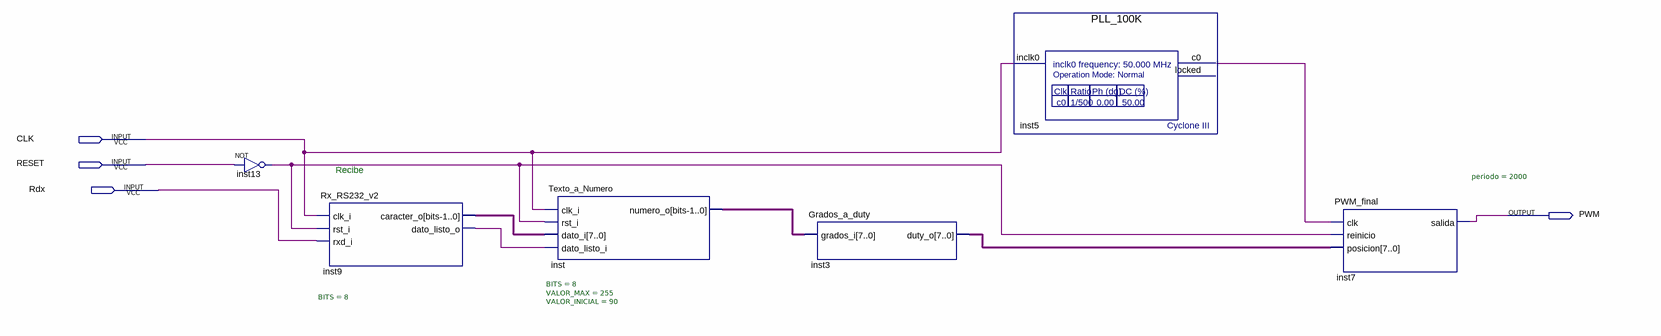
[diagram p0: schematic sheet]
// Quartus schematic Prueba_comunicacion.bdf as structural Verilog: 6 symbols, 4 pins
module Prueba_comunicacion (
  input  CLK,
  input  RESET,
  input  Rdx,
  output PWM
);

  wire inst5_c0, inst9_dato_listo_o, inst13_out;
  wire [7:0] inst3_duty_o, inst9_caracter_o, inst_numero_o;

  not inst13 (inst13_out, RESET);
  Rx_RS232_v2 #(.BITS(8)) inst9 (
    .clk_i(CLK), .rst_i(inst13_out), .rxd_i(Rdx), .caracter_o(inst9_caracter_o),
    .dato_listo_o(inst9_dato_listo_o));
  Texto_a_Numero #(.BITS(8), .VALOR_MAX(255), .VALOR_INICIAL(90)) inst (
    .clk_i(CLK), .rst_i(inst13_out), .dato_i(inst9_caracter_o), .dato_listo_i(inst9_dato_listo_o),
    .numero_o(inst_numero_o));
  Grados_a_duty inst3 (.grados_i(inst_numero_o), .duty_o(inst3_duty_o));
  PLL_100K inst5 (.inclk0(CLK), .c0(inst5_c0));  // open: locked
  PWM_final #(.periodo(2000)) inst7 (.clk(inst5_c0), .reinicio(inst13_out), .posicion(inst3_duty_o), .salida(PWM));

  // Notes on the sheet:
  //   Recibe
endmodule
